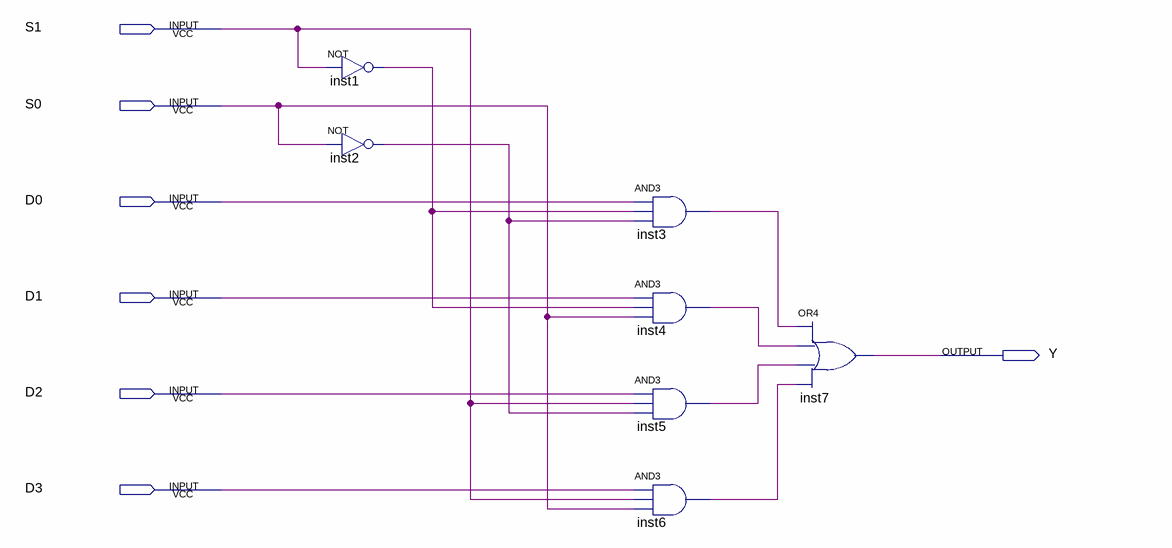
[diagram p0: schematic sheet]
// Quartus schematic mux4x1.bdf as structural Verilog: 7 symbols, 7 pins
module mux4x1 (
  input  S1,
  input  S0,
  input  D0,
  input  D1,
  input  D2,
  input  D3,
  output Y
);

  wire inst1_out, inst2_out, inst3_out, inst4_out, inst5_out, inst6_out;

  not inst1 (inst1_out, S1);
  not inst2 (inst2_out, S0);
  and inst3 (inst3_out, D0, inst1_out, inst2_out);
  and inst4 (inst4_out, D1, inst1_out, S0);
  and inst5 (inst5_out, D2, S1, inst2_out);
  and inst6 (inst6_out, D3, S1, S0);
  or inst7 (Y, inst3_out, inst4_out, inst5_out, inst6_out);
endmodule
